# Altium schematic sheet Sensor_DPS368.SchDoc: Sensors - Barometer 1 DPS368 (SPI1)
size A3; ApprovedBy: Weymen Koo; CheckedBy: -; DrawnBy: Weymen Koo; DocumentNumber: UBCAD-FCSOM-SCH; Revision: A; SheetNumber: 6; SheetTotal: 18; ProjectTitle: Flight Controller SoM; Status: PRELIMINARY; ReleaseDate: 2026-11-14
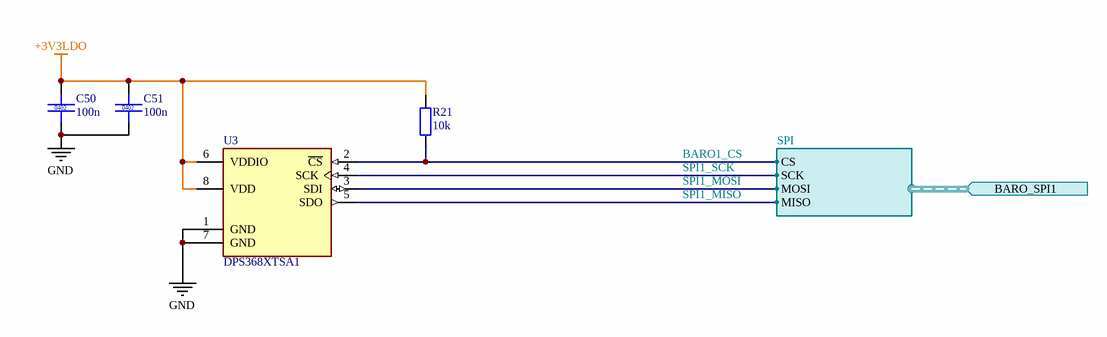
[diagram p0: Sensor_DPS368.SchDoc]

## Parts
C50  100n  [CAPC1005X05N]
C51  100n  [CAPC1005X05N]
R21  10k  [IPC C R0402 NO SILK]
U3  DPS368XTSA1  [FP-PG-VLGA-8-MFG]

## Ports
BARO_SPI1 (in, harness SPI, see 1[5B], 4[5D])

## Harnesses
SPI: CS, SCK, MOSI, MISO

## Nets
+3V3LDO: C50.1 C51.1 R21.2 U3.6(VDDIO) U3.8(VDD)
GND: C50.2 C51.2 U3.1(GND) U3.7(GND)
BARO1_CS: R21.1 U3.2(~{CS}) ; port BARO_SPI1.CS
SPI1_MISO: U3.5(SDO) ; port BARO_SPI1.MISO
SPI1_MOSI: U3.3(SDI) ; port BARO_SPI1.MOSI
SPI1_SCK: U3.4(SCK) ; port BARO_SPI1.SCK

## Notes on the sheet
- PROJECT
- KEY
- POWER
- 5 V class
- 3.3 V class
- Core / SMPS
- GND
- SHEET TITLE
- SIGNALS
- NOTES
- SPI
- Analog
- Design
- I2C
- PWM/Timer
- Layout
- UART/RC
- GPIO/Ctrl
- Assembly
- CAN
- Unused pin
- Firmware
- USB/SD/Clk
- Critical
- DRAWN
- DOCUMENT NO.
- CHECKED
- REV
- STATUS
- APPROVED
- DATE
- FILE
- SIZE
- A3
- SHEET
- of

## Library data of the parts
C50 C51 = CMP-002-000094-5: CAP 100n 16V X7R 10% 0402; Manufacturer: Samsung; Manufacturer Part Number: CL05B104KO5NNNC; Value: 100n; Tolerance: 10%; Package: 0402; Voltage: 16V; Dielectric: X7R; LCSC Part #: C1525
R21 = CMP-008-000000-2: RES 10k 1% 1/16W 0402; Manufacturer: UNI-ROYAL; Manufacturer Part Number: 0402WGF1002TCE; Value: 10k; Source: Schlib1.SchLib; Design Item ID: Generic RES 0402; Package: 0402; Tolerance: 1%; Power: 1/16W; LCSC Part #: C25744
U3 = CMP-292-000000-1: DIGITAL PRESSURE SENSOR; Manufacturer: Infineon; Sensor Output: I2C,SPI; Max Supply Voltage: 3.6V; Min Supply Voltage: 1.2V; Port Style: No Port; Operating Supply Current: 345uA; Device Class L2: Pressure Sensors; Device Class L1: Sensors; Source: CRLS Lib.SchLib; Temperature: -40°C to +85°C; Pin Count: 8; Lead Free: Yes; Temperature Range Low: -40°C; RoHS: TRUE; Manufacturer Part Number: DPS368XTSA1; Temperature Range High: 85°C; Ambient Temperature Range High: +85°C; Octopart: https://octopart.com/dps368xtsa1-infineon-98278029; Device Class L3: unset; Ambient Temperature Range Low: -40°C; Height: 1.1mm; Automotive: No; Package: PG-VLGA-8; Component Type: Standard; Category: IC; Digikey Description: DIGITAL PRESSURE SENSOR; Design Item ID: BARO_DPS368XTSA1; Footprint Url: https://www.infineon.com/cms/en/product/packages/PG-VLGA/PG-VLGA-8-2/